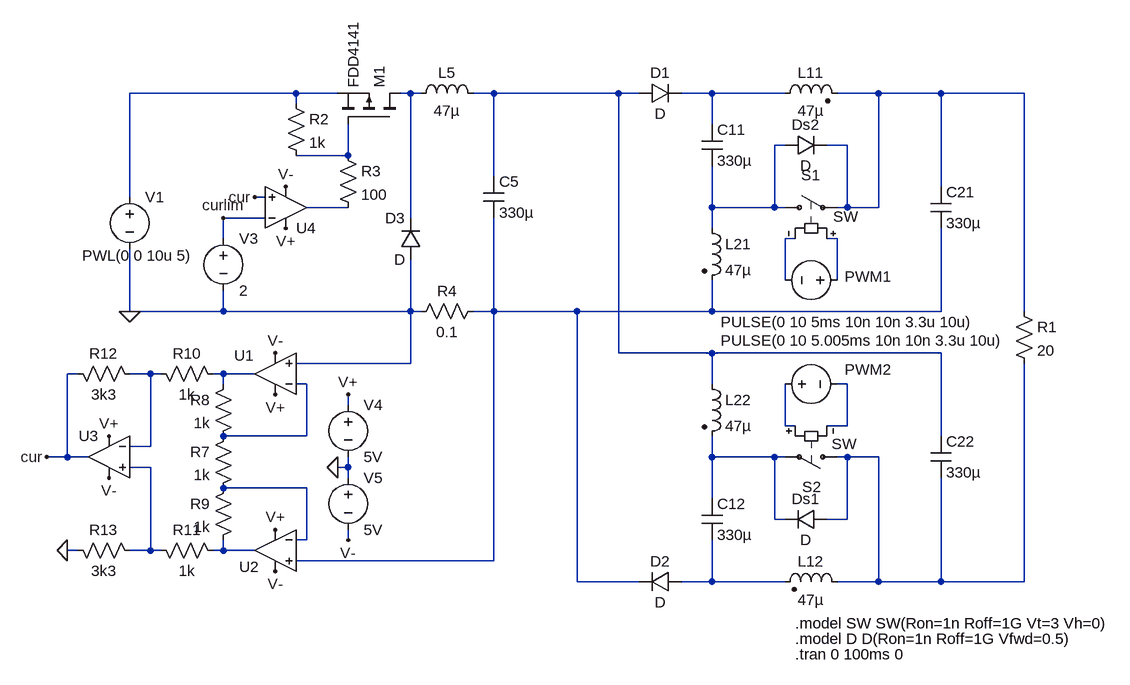
[diagram p0: schematic BC_Type3_Inrush.asc]
BC_Type3_Inrush.asc, the LTspice schematic file:
Version 4
SHEET 1 984 836
WIRE -640 -224 -896 -224
WIRE -576 -224 -640 -224
WIRE -464 -224 -480 -224
WIRE -448 -224 -464 -224
WIRE -336 -224 -368 -224
WIRE -144 -224 -336 -224
WIRE -112 -224 -144 -224
WIRE 0 -224 -48 -224
WIRE 112 -224 0 -224
WIRE 256 -224 192 -224
WIRE 352 -224 256 -224
WIRE 480 -224 352 -224
WIRE -640 -208 -640 -224
WIRE 0 -176 0 -224
WIRE 112 -144 96 -144
WIRE 208 -144 176 -144
WIRE -560 -128 -560 -176
WIRE -560 -128 -640 -128
WIRE -336 -96 -336 -224
WIRE 352 -80 352 -224
WIRE -896 -64 -896 -224
WIRE -688 -64 -704 -64
WIRE -560 -48 -624 -48
WIRE 0 -48 0 -112
WIRE 96 -48 96 -144
WIRE 96 -48 0 -48
WIRE 112 -48 96 -48
WIRE 208 -48 208 -144
WIRE 208 -48 192 -48
WIRE 256 -48 256 -224
WIRE 256 -48 208 -48
WIRE -688 -32 -752 -32
WIRE -464 -32 -464 -224
WIRE 0 -16 0 -48
WIRE -752 0 -752 -32
WIRE 128 0 112 0
WIRE 192 0 176 0
WIRE 112 64 112 0
WIRE 192 64 192 0
WIRE -896 112 -896 16
WIRE -752 112 -752 80
WIRE -752 112 -896 112
WIRE -464 112 -464 32
WIRE -464 112 -752 112
WIRE -448 112 -464 112
WIRE -336 112 -336 -32
WIRE -336 112 -368 112
WIRE -208 112 -336 112
WIRE 0 112 0 64
WIRE 0 112 -208 112
WIRE 352 112 352 -16
WIRE 352 112 0 112
WIRE 480 112 480 -224
WIRE -144 176 -144 -224
WIRE 0 176 -144 176
WIRE 352 176 0 176
WIRE -464 192 -464 112
WIRE -464 192 -640 192
WIRE -976 208 -992 208
WIRE -864 208 -896 208
WIRE -848 208 -864 208
WIRE -752 208 -768 208
WIRE -704 208 -752 208
WIRE -752 224 -752 208
WIRE -624 224 -640 224
WIRE 0 224 0 176
WIRE 208 224 192 224
WIRE -560 256 -560 240
WIRE 112 288 112 224
WIRE 128 288 112 288
WIRE 208 288 208 224
WIRE 208 288 176 288
WIRE -624 304 -624 224
WIRE -624 304 -752 304
WIRE 352 304 352 176
WIRE -864 320 -864 208
WIRE -864 320 -896 320
WIRE -992 336 -992 208
WIRE -992 336 -1024 336
WIRE -960 336 -992 336
WIRE 0 336 0 304
WIRE 96 336 0 336
WIRE 112 336 96 336
WIRE 208 336 192 336
WIRE 256 336 208 336
WIRE -864 352 -896 352
WIRE -560 352 -560 336
WIRE -560 352 -576 352
WIRE -560 368 -560 352
WIRE -624 384 -752 384
WIRE 0 400 0 336
WIRE 96 432 96 336
WIRE 112 432 96 432
WIRE 208 432 208 336
WIRE 208 432 176 432
WIRE -624 464 -624 384
WIRE -624 464 -640 464
WIRE -560 464 -560 448
WIRE -976 480 -992 480
WIRE -864 480 -864 352
WIRE -864 480 -896 480
WIRE -848 480 -864 480
WIRE -752 480 -752 464
WIRE -752 480 -768 480
WIRE -704 480 -752 480
WIRE -336 496 -336 112
WIRE -336 496 -640 496
WIRE -208 528 -208 112
WIRE -112 528 -208 528
WIRE 0 528 0 464
WIRE 0 528 -48 528
WIRE 112 528 0 528
WIRE 256 528 256 336
WIRE 256 528 192 528
WIRE 352 528 352 368
WIRE 352 528 256 528
WIRE 480 528 480 192
WIRE 480 528 352 528
FLAG -896 112 0
FLAG -672 240 V+
FLAG -672 448 V+
FLAG -928 304 V+
FLAG -928 368 V-
FLAG -672 176 V-
FLAG -672 512 V-
FLAG -576 352 0
FLAG -560 464 V-
FLAG -560 240 V+
FLAG -992 480 0
FLAG -656 -16 V+
FLAG -704 -64 cur
FLAG -752 -32 curlim
FLAG -1024 336 cur
FLAG -656 -80 V-
SYMBOL voltage -896 -80 R0
WINDOW 123 0 0 Left 0
WINDOW 39 0 0 Left 0
WINDOW 3 -73 106 Left 2
SYMATTR Value PWL(0 0 10u 5)
SYMATTR InstName V1
SYMBOL pmos -480 -176 M270
SYMATTR InstName M1
SYMATTR Value FDD4141
SYMBOL res -656 -224 R0
SYMATTR InstName R2
SYMATTR Value 1k
SYMBOL res -576 -144 R0
SYMATTR InstName R3
SYMATTR Value 100
SYMBOL OpAmps\\UniversalOpAmp2 -672 208 R180
WINDOW 0 33 28 Left 2
SYMATTR InstName U1
SYMATTR Value2 Avol=1Meg GBW=100Meg Slew=100Meg
SYMBOL OpAmps\\UniversalOpAmp2 -672 480 M0
WINDOW 0 25 25 Left 2
SYMATTR InstName U2
SYMATTR Value2 Avol=1Meg GBW=100Meg Slew=100Meg
SYMBOL OpAmps\\UniversalOpAmp2 -928 336 M0
SYMATTR InstName U3
SYMATTR Value2 Avol=1Meg GBW=100Meg Slew=100Meg
SYMBOL res -736 288 M0
SYMATTR InstName R7
SYMATTR Value 1k
SYMBOL res -736 208 M0
SYMATTR InstName R8
SYMATTR Value 1k
SYMBOL res -736 368 M0
SYMATTR InstName R9
SYMATTR Value 1k
SYMBOL res -864 192 M90
WINDOW 0 0 56 VBottom 2
WINDOW 3 32 56 VTop 2
SYMATTR InstName R10
SYMATTR Value 1k
SYMBOL res -864 464 M90
WINDOW 0 0 56 VBottom 2
WINDOW 3 32 56 VTop 2
SYMATTR InstName R11
SYMATTR Value 1k
SYMBOL res -992 192 M90
WINDOW 0 0 56 VBottom 2
WINDOW 3 32 56 VTop 2
SYMATTR InstName R12
SYMATTR Value 3k3
SYMBOL res -992 464 M90
WINDOW 0 0 56 VBottom 2
WINDOW 3 32 56 VTop 2
SYMATTR InstName R13
SYMATTR Value 3k3
SYMBOL voltage -560 240 R0
WINDOW 123 0 0 Left 0
WINDOW 39 0 0 Left 0
SYMATTR InstName V4
SYMATTR Value 5V
SYMBOL voltage -560 352 R0
WINDOW 123 0 0 Left 0
WINDOW 39 0 0 Left 0
SYMATTR InstName V5
SYMATTR Value 5V
SYMBOL OpAmps\\UniversalOpAmp2 -656 -48 M180
SYMATTR InstName U4
SYMATTR Value2 Avol=1Meg GBW=100Meg Slew=100Meg
SYMBOL voltage -752 -16 R0
WINDOW 123 0 0 Left 0
WINDOW 39 0 0 Left 0
SYMATTR InstName V3
SYMATTR Value 2
SYMBOL diode -448 32 R180
WINDOW 0 24 64 Left 2
WINDOW 3 24 0 Left 2
SYMATTR InstName D3
SYMBOL cap -352 -96 R0
SYMATTR InstName C5
SYMATTR Value 330µ
SYMATTR SpiceLine Rser=.09
SYMBOL res -352 96 R90
WINDOW 0 0 56 VBottom 2
WINDOW 3 32 56 VTop 2
SYMATTR InstName R4
SYMATTR Value 0.1
SYMBOL ind -464 -208 R270
WINDOW 0 32 56 VTop 2
WINDOW 3 5 56 VBottom 2
SYMATTR InstName L5
SYMATTR Value 47µ
SYMATTR SpiceLine Rser=3m
SYMBOL cap -16 -176 R0
SYMATTR InstName C11
SYMATTR Value 330µ
SYMATTR SpiceLine Rser=0.09
SYMBOL ind2 -16 -32 R0
SYMATTR InstName L21
SYMATTR Value 47µ
SYMATTR Type ind
SYMATTR SpiceLine Rser=3m
SYMBOL ind2 96 -208 R270
WINDOW 0 32 56 VTop 2
WINDOW 3 5 56 VBottom 2
SYMATTR InstName L11
SYMATTR Value 47µ
SYMATTR Type ind
SYMATTR SpiceLine Rser=3m
SYMBOL cap 336 -80 R0
SYMATTR InstName C21
SYMATTR Value 330µ
SYMATTR SpiceLine Rser=0.09
SYMBOL cap -16 400 R0
SYMATTR InstName C12
SYMATTR Value 330µ
SYMATTR SpiceLine Rser=0.09
SYMBOL ind2 -16 208 R0
SYMATTR InstName L22
SYMATTR Value 47µ
SYMATTR Type ind
SYMATTR SpiceLine Rser=3m
SYMBOL ind2 208 544 M270
WINDOW 0 32 56 VTop 2
WINDOW 3 4 56 VBottom 2
SYMATTR InstName L12
SYMATTR Value 47µ
SYMATTR Type ind
SYMATTR SpiceLine Rser=3m
SYMBOL cap 336 304 R0
SYMATTR InstName C22
SYMATTR Value 330µ
SYMATTR SpiceLine Rser=0.09
SYMBOL res 464 96 R0
SYMATTR InstName R1
SYMATTR Value 20
SYMBOL sw 96 -48 R270
WINDOW 0 50 41 VRight 2
WINDOW 3 -14 90 VRight 2
SYMATTR InstName S1
SYMBOL sw 208 336 R90
WINDOW 0 46 40 VRight 2
WINDOW 3 -20 -14 VRight 2
SYMATTR InstName S2
SYMBOL voltage 208 64 R90
WINDOW 0 10 -32 VBottom 2
WINDOW 3 49 0 VTop 2
WINDOW 123 0 0 Left 0
WINDOW 39 0 0 Left 0
SYMATTR InstName PWM1
SYMATTR Value PULSE(0 10 5ms 10n 10n 3.3u 10u)
SYMBOL voltage 96 224 R270
WINDOW 0 7 144 VTop 2
WINDOW 3 83 136 VBottom 2
WINDOW 123 0 0 Left 0
WINDOW 39 0 0 Left 0
SYMATTR InstName PWM2
SYMATTR Value PULSE(0 10 5.005ms 10n 10n 3.3u 10u)
SYMBOL diode -112 -208 R270
WINDOW 0 32 32 VTop 2
WINDOW 3 0 32 VBottom 2
SYMATTR InstName D1
SYMBOL diode -48 512 R90
WINDOW 0 0 32 VBottom 2
WINDOW 3 32 32 VTop 2
SYMATTR InstName D2
SYMBOL diode 176 416 R90
WINDOW 0 0 32 VBottom 2
WINDOW 3 32 32 VTop 2
SYMATTR InstName Ds1
SYMBOL diode 112 -128 R270
WINDOW 0 32 32 VTop 2
WINDOW 3 0 32 VBottom 2
SYMATTR InstName Ds2
TEXT 128 592 Left 2 !.model SW SW(Ron=1n Roff=1G Vt=3 Vh=0)
TEXT 128 640 Left 2 !.tran 0 100ms 0
TEXT 128 616 Left 2 !.model D D(Ron=1n Roff=1G Vfwd=0.5)

The netlist it stands for:
* BC_Type3_Inrush.asc
V1 N001 0 PWL(0 0 10u 5)
M1 N002 N007 N001 N001 FDD4141
R2 N001 N007 1k
R3 N007 N008 100
XU1 0 N014 V+ V- N013 level2 Avol=1Meg GBW=100Meg Slew=100Meg Ilimit=25m Rail=0 Vos=0 En=0 Enk=0 In=0 Ink=0 Rin=500Meg  ; pins In+ In- V+ V- OUT
XU2 N011 N020 V+ V- N021 level2 Avol=1Meg GBW=100Meg Slew=100Meg Ilimit=25m Rail=0 Vos=0 En=0 Enk=0 In=0 Ink=0 Rin=500Meg  ; pins In+ In- V+ V- OUT
XU3 N019 N012 V+ V- cur level2 Avol=1Meg GBW=100Meg Slew=100Meg Ilimit=25m Rail=0 Vos=0 En=0 Enk=0 In=0 Ink=0 Rin=500Meg  ; pins In+ In- V+ V- OUT
R7 N014 N020 1k
R8 N013 N014 1k
R9 N020 N021 1k
R10 N012 N013 1k
R11 N019 N021 1k
R12 cur N012 3k3
R13 0 N019 3k3
V4 V+ 0 5V
V5 0 V- 5V
XU4 cur curlim V+ V- N008 level2 Avol=1Meg GBW=100Meg Slew=100Meg Ilimit=25m Rail=0 Vos=0 En=0 Enk=0 In=0 Ink=0 Rin=500Meg  ; pins In+ In- V+ V- OUT
V3 curlim 0 2
D3 0 N002 D
C5 N003 N011 330µ Rser=.09
R4 N011 0 0.1
L5 N002 N003 47µ Rser=3m
C11 N004 N006 330µ Rser=0.09
L21 N006 N011 47µ Rser=3m
L11 N004 N005 47µ Rser=3m
C21 N005 N011 330µ Rser=0.09
C12 N017 N022 330µ Rser=0.09
L22 N003 N017 47µ Rser=3m
L12 N018 N022 47µ Rser=3m
C22 N003 N018 330µ Rser=0.09
R1 N005 N018 20
S1 N006 N005 N010 N009 SW
S2 N018 N017 N016 N015 SW
V§PWM1 N010 N009 PULSE(0 10 5ms 10n 10n 3.3u 10u)
V§PWM2 N016 N015 PULSE(0 10 5.005ms 10n 10n 3.3u 10u)
D1 N003 N004 D
D2 N022 N011 D
Ds1 N018 N017 D
Ds2 N006 N005 D
.model D D
.lib standard.dio
.model NMOS NMOS
.model PMOS PMOS
.lib standard.mos
.model SW SW(Ron=1n Roff=1G Vt=3 Vh=0)
.tran 0 100ms 0
.model D D(Ron=1n Roff=1G Vfwd=0.5)
.lib UniversalOpAmp2.lib
.backanno
.end